# Altium schematic sheet Bulk_power_converter.SchDoc: High power 3.3V power supply
size A4; DocumentNumber: ADC-SCH-11; SheetNumber: 11; SheetTotal: 20
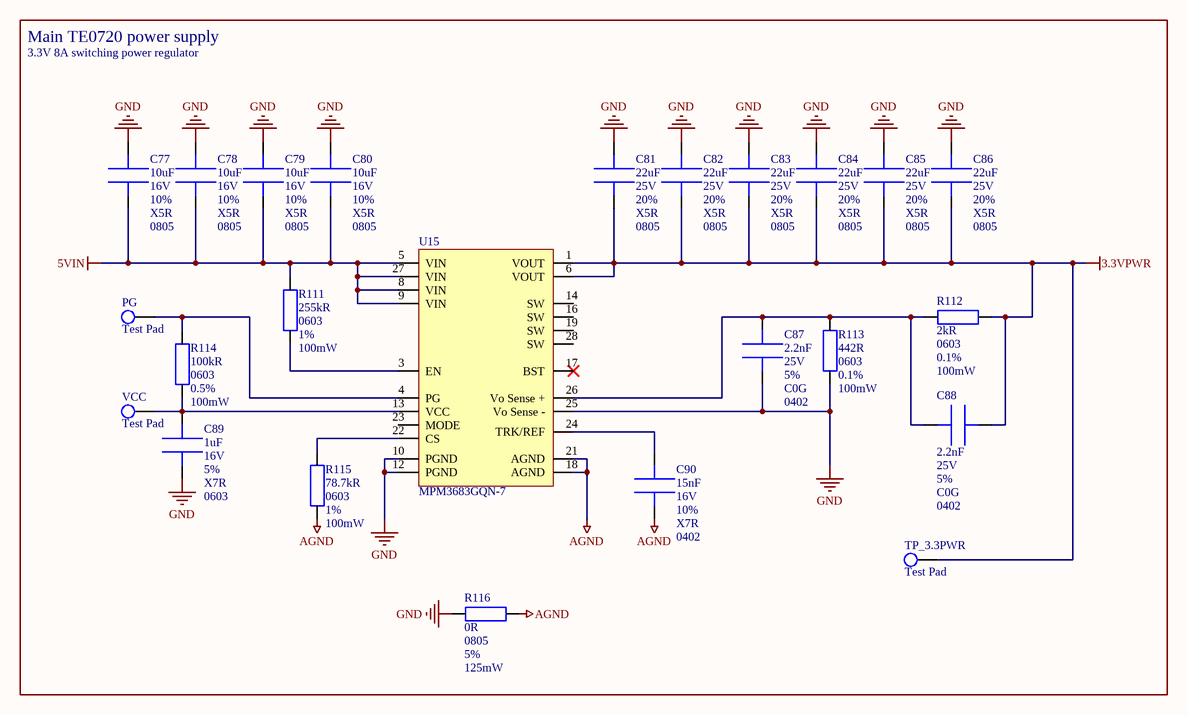
[diagram p0: Bulk_power_converter.SchDoc]

## Parts
C77  value 10uF  Voltage: 16V  Tolerance: 10%  Dielectric: X5R  Package: 0805  [CAPC_0805]  (hidden comment: EMK212BJ106KG-T)
C78  value 10uF  Voltage: 16V  Tolerance: 10%  Dielectric: X5R  Package: 0805  [CAPC_0805]  (hidden comment: EMK212BJ106KG-T)
C79  value 10uF  Voltage: 16V  Tolerance: 10%  Dielectric: X5R  Package: 0805  [CAPC_0805]  (hidden comment: EMK212BJ106KG-T)
C80  value 10uF  Voltage: 16V  Tolerance: 10%  Dielectric: X5R  Package: 0805  [CAPC_0805]  (hidden comment: EMK212BJ106KG-T)
C81  value 22uF  Voltage: 25V  Tolerance: 20%  Dielectric: X5R  Package: 0805  [CAPC_0805]  (hidden comment: CL21A226MAYNNNE)
C82  value 22uF  Voltage: 25V  Tolerance: 20%  Dielectric: X5R  Package: 0805  [CAPC_0805]  (hidden comment: CL21A226MAYNNNE)
C83  value 22uF  Voltage: 25V  Tolerance: 20%  Dielectric: X5R  Package: 0805  [CAPC_0805]  (hidden comment: CL21A226MAYNNNE)
C84  value 22uF  Voltage: 25V  Tolerance: 20%  Dielectric: X5R  Package: 0805  [CAPC_0805]  (hidden comment: CL21A226MAYNNNE)
C85  value 22uF  Voltage: 25V  Tolerance: 20%  Dielectric: X5R  Package: 0805  [CAPC_0805]  (hidden comment: CL21A226MAYNNNE)
C86  value 22uF  Voltage: 25V  Tolerance: 20%  Dielectric: X5R  Package: 0805  [CAPC_0805]  (hidden comment: CL21A226MAYNNNE)
C87  value 2.2nF  Voltage: 25V  Tolerance: 5%  Dielectric: C0G  Package: 0402  [CAPC_0402]  (hidden comment: C0402C222J3GACTU)
C88  value 2.2nF  Voltage: 25V  Tolerance: 5%  Dielectric: C0G  Package: 0402  [CAPC_0402]  (hidden comment: C0402C222J3GACTU)
C89  value 1uF  Voltage: 16V  Tolerance: 5%  Dielectric: X7R  Package: 0603  [CAPC_0603]  (hidden comment: CC0603JRX7R7BB105)
C90  value 15nF  Voltage: 16V  Tolerance: 10%  Dielectric: X7R  Package: 0402  [CAPC_0402]  (hidden comment: C0402C153K4RAC)
PG  Test Pad  [TP_1mm]
R111  value 255kR  Package: 0603  Tolerance: 1%  Power: 100mW  [RESC_0603]  (hidden comment: AC0603FR-07255KL)
R112  value 2kR  Package: 0603  Tolerance: 0.1%  Power: 100mW  [RESC_0603]  (hidden comment: RT0603BRD072KL)
R113  value 442R  Package: 0603  Tolerance: 0.1%  Power: 100mW  [RESC_0603]  (hidden comment: RT0603BRD07442RL)
R114  value 100kR  Package: 0603  Tolerance: 0.5%  Power: 100mW  [RESC_0603]  (hidden comment: AC0603DR-07100KL)
R115  value 78.7kR  Package: 0603  Tolerance: 1%  Power: 100mW  [RESC_0603]  (hidden comment: AC0603FR-0778K7L)
R116  value 0R  Package: 0805  Tolerance: 5%  Power: 125mW  [RESC_0805]  (hidden comment: RC0805JR-070RP)
TP_3.3PWR  Test Pad  [TP_1.4mm]
U15  MPM3683GQN-7  [IC_MPM3683GQN-7]
VCC  Test Pad  [TP_1mm]

## Nets
3.3VPWR: C81.2 C82.2 C83.2 C84.2 C85.2 C86.2 C88.1 R112.1 TP_3.3PWR.1 U15.1(VOUT) U15.6(VOUT)
5VIN: C77.2 C78.2 C79.2 C80.2 R111.1 U15.5(VIN) U15.8(VIN) U15.9(VIN) U15.27(VIN)
AGND: C90.2 R115.2 R116.1 U15.18(AGND) U15.21(AGND)
GND: C77.1 C78.1 C79.1 C80.1 C81.1 C82.1 C83.1 C84.1 C85.1 C86.1 C87.2 C89.2 R113.2 R116.2 U15.10(PGND) U15.12(PGND) U15.25(Vo_Sense_-)
NetC87_1: C87.1 C88.2 R112.2 R113.1 U15.26(Vo_Sense_+)
NetC89_1: C89.1 R114.1 U15.13(VCC) VCC.1
NetC90_1: C90.1 U15.24(TRK/REF)
NetPG_1: PG.1 R114.2 U15.4(PG)
NetR111_2: R111.2 U15.3(EN)
NetR115_1: R115.1 U15.22(CS)

Not connected (* = marked no-connect by the designer): U15 14(SW) 16(SW) 17(BST)* 19(SW) 23(MODE) 28(SW)

## Notes on the sheet
- Main TE0720 power supply
- 3.3V 8A switching power regulator
- Drawn by
- Approved by
- Document type
- Date of issue
- Legal owner
- Title
- Circuit diagram
- File
- AGH Marines
- Document no.
- Revision
- Status
- Sheet
- Size
- Lang.
- /
- A4
- EN

## Library data of the parts
C77-C80 = EMK212BJ106KG-T: Multilayer Ceramic Capacitors MLCC - SMD/SMT 16V 10uF X5R 0805 10 %; Manufacturer: TAIYO YUDEN; Supplier 1: Mouser; Supplier Part Number 1: 963-EMK212BJ106KG-T
C81-C86 = CL21A226MAYNNNE: Multilayer Ceramic Capacitors MLCC - SMD/SMT 22uF+/-20% 25V X5R 2 0805; Manufacturer: TAIYO YUDEN; Supplier 1: Mouser; Supplier Part Number 1: 187-CL21A226MAYNNNE
C87 C88 = C0402C222J3GACTU: Multilayer Ceramic Capacitors MLCC - SMD/SMT 25V 2200pF C0G 0402 5%; Manufacturer: KEMET; Supplier 1: Mouser; Supplier Part Number 1: 80-C0402C222J3GACTU
C89 = CC0603JRX7R7BB105: Multilayer Ceramic Capacitors MLCC - SMD/SMT 16V 1uF X7R 0603 5% HI CV; Manufacturer: YAGEO; Supplier 1: Mouser; Supplier Part Number 1: 603-CC0603JRX77BB105
C90 = C0402C153K4RAC: Multilayer Ceramic Capacitors MLCC - SMD/SMT 16V 0.015uF X7R 0402 10%; Manufacturer: KEMET; Supplier 1: Mouser; Supplier Part Number 1: 80-C0402C153K4RAC
R111 = AC0603FR-07255KL: Thick Film Resistors - SMD 255 kOhms 1/10 W 75 V 1 % 0603 100 PPM / C - 55 C / + 155 C AEC-Q200; Manufacturer: YAGEO; Supplier 1: Mouser; Supplier Part Number 1: 603-AC0603FR-07255KL
R112 = RT0603BRD072KL: Thin Film Resistors 2K OHM .1% 25PPM; Manufacturer: YAGEO; Supplier 1: Mouser; Supplier Part Number 1: 603-RT0603BRD072KL
R113 = RT0603BRD07442RL: Thin Film Resistors 1/10W 442 ohm .1% 25ppm; Manufacturer: YAGEO; Supplier 1: Mouser; Supplier Part Number 1: 603-RT0603BRD07442RL
R114 = AC0603DR-07100KL: Thick Film Resistors - SMD 100 kOhms 1/10 W 75 V 0.5 % 0603 100 PPM / C - 55 C / + 155 C AEC-Q200; Manufacturer: YAGEO; Supplier 1: Mouser; Supplier Part Number 1: 603-AC0603DR-07100KL
R115 = AC0603FR-0778K7L: Thick Film Resistors - SMD 78.7 kOhms 1/10 W 75 V 1% 0603 100 PPM / C - 55 C / + 155 C AEC-Q200; Manufacturer: YAGEO; Supplier 1: Mouser; Supplier Part Number 1: 603-AC0603FR-0778K7L
R116 = RC0805JR-070RP: Thick Film Resistors - SMD General Purpose Chip Resistor 0805, 0Ohms, 5%, 1/8W; Manufacturer: YAGEO; Supplier 1: Mouser; Supplier Part Number 1: 603-RC0805JR-070RP
U15 = MPM3683GQN-7: Power Management Modules 2.7V-16V, 8A, Step-Down Power Module; Manufacturer: Monolithic Power Systems (MPS); Supplier 1: Mouser; Supplier Part Number 1: 946-MPM3683GQN-7-Z